# Altium schematic sheet FK.SchDoc: ИЛ1418ТО1/1
size 410 x 297 mm; ApprovedBy: Стерхов В.Д.; CheckedBy: Стерхов В.Д.; Author: Сергеев Д.А.; CompanyName: ГК "СНАБЖЕНИЕ"; DrawnBy: Сергеев Д.А.; Engineer: Сергеев Д.А.; Organization: ГК "СНАБЖЕНИЕ"; DocumentNumber: ИЛ1418ТО1/1; Revision: 1; SheetNumber: 2; SheetTotal: 2
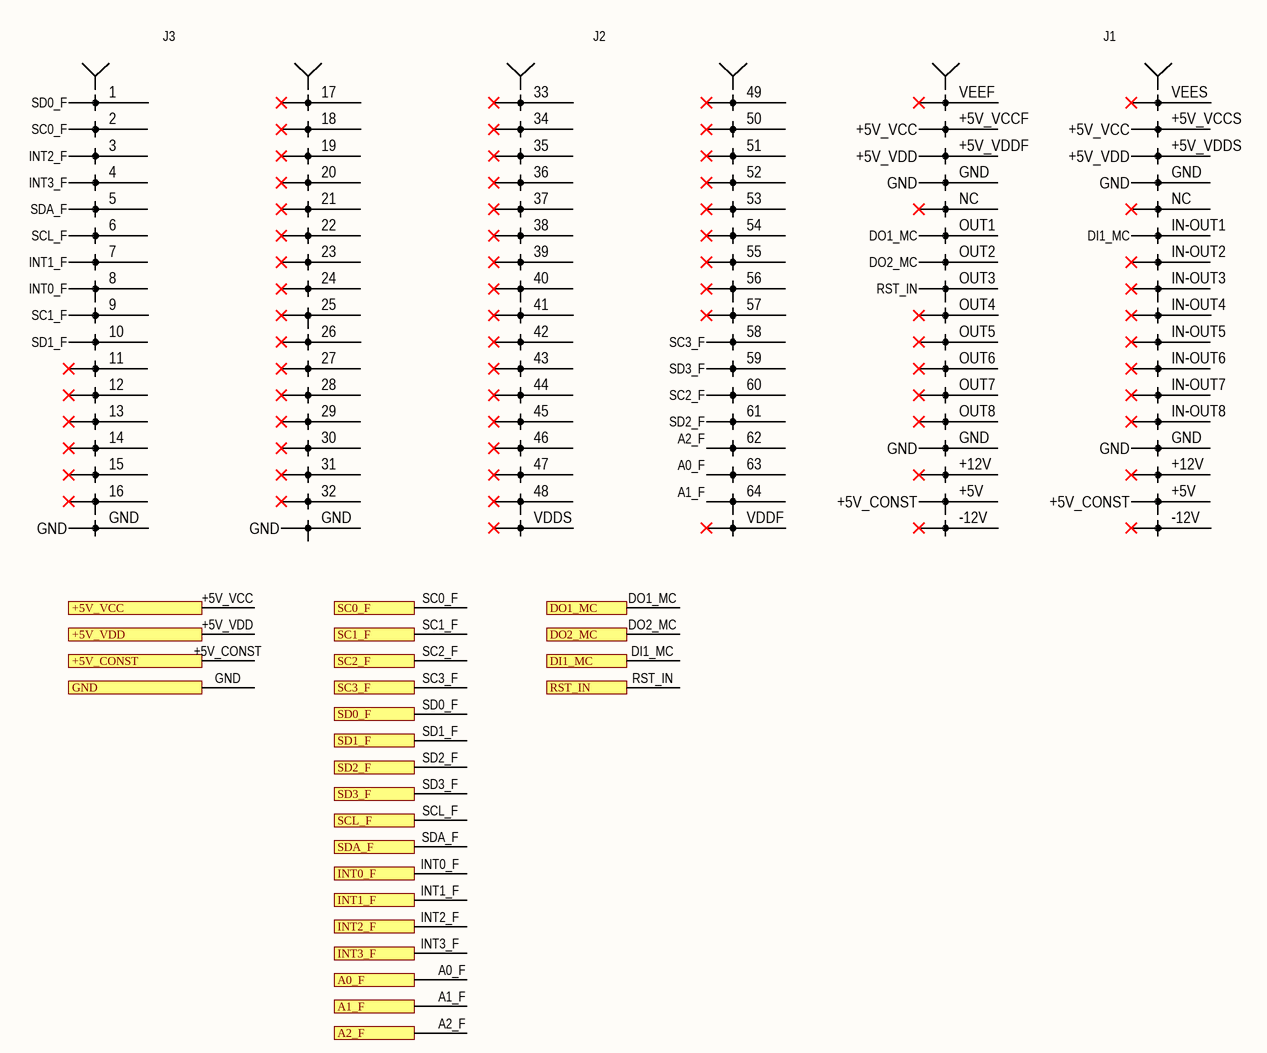
[diagram p0: FK.SchDoc]

## Parts
X1  FORMULA  [FORMULA]  (value not drawn)

## Ports
+5V_CONST, +5V_VCC, +5V_VDD, A0_F, A1_F, A2_F, DI1_MC, DO1_MC, DO2_MC, GND, INT0_F, INT1_F, INT2_F, INT3_F, RST_IN, SC0_F, SC1_F, SC2_F, SC3_F, SCL_F, SD0_F, SD1_F, SD2_F, SD3_F, SDA_F

## Nets
+5V_CONST: X1.+5V ; port +5V_CONST
+5V_VCC: X1.+5V_VCCF(VCCF) X1.+5V_VCCS(VCCS) ; port +5V_VCC
+5V_VDD: X1.+5V_VDDF(VDDF) X1.+5V_VDDS(VDDS) ; port +5V_VDD
A0_F: X1.63 ; port A0_F
A1_F: X1.64 ; port A1_F
A2_F: X1.62 ; port A2_F
DI1_MC: X1.IN-OUT1 ; port DI1_MC
DO1_MC: X1.OUT1 ; port DO1_MC
DO2_MC: X1.OUT2 ; port DO2_MC
GND: X1.GND ; port GND
INT0_F: X1.8 ; port INT0_F
INT1_F: X1.7 ; port INT1_F
INT2_F: X1.3 ; port INT2_F
INT3_F: X1.4 ; port INT3_F
RST_IN: X1.OUT3 ; port RST_IN
SC0_F: X1.2 ; port SC0_F
SC1_F: X1.9 ; port SC1_F
SC2_F: X1.60 ; port SC2_F
SC3_F: X1.58 ; port SC3_F
SCL_F: X1.6 ; port SCL_F
SD0_F: X1.1 ; port SD0_F
SD1_F: X1.10 ; port SD1_F
SD2_F: X1.61 ; port SD2_F
SD3_F: X1.59 ; port SD3_F
SDA_F: X1.5 ; port SDA_F

Not connected (* = marked no-connect by the designer): X1 11* 12* 13* 14* 15* 16* 17* 18* 19* 20* 21* 22* 23* 24* 25* 26* 27* 28* 29* 30* 31* 32* 33* 34* 35* 36(4)* 37(5)* 38* 39* 40* 41* 42* 43* 44* 45* 46* 47* 48* 49* 50* 51* 52* 53* 54* 55* 56* 57* +12V* -12V* IN-OUT2* IN-OUT3* IN-OUT4* IN-OUT5* IN-OUT6* IN-OUT7* IN-OUT8* NC* OUT4* OUT5* OUT6* OUT7* OUT8* VDDF* VDDS* VEEF* VEES*

## Notes on the sheet
- Перв. примен.
- Справ. №
- Подп. и дата
- Инв. № дубл.
- Взам. инв. №
- Разраб.
- Изм.
- Лист
- № докум.
- Подп.
- Дата
- Литера
- Масса
- Масштаб
- Пров.
- Т.контр.
- Листов
- Инв. № подл.
- Н.контр.
- Утв.
- Форма 1 ГОСТ 2.104-2006
- Копировал
- Формат А3
- (in symbol FORMULA) J3; J2; J1